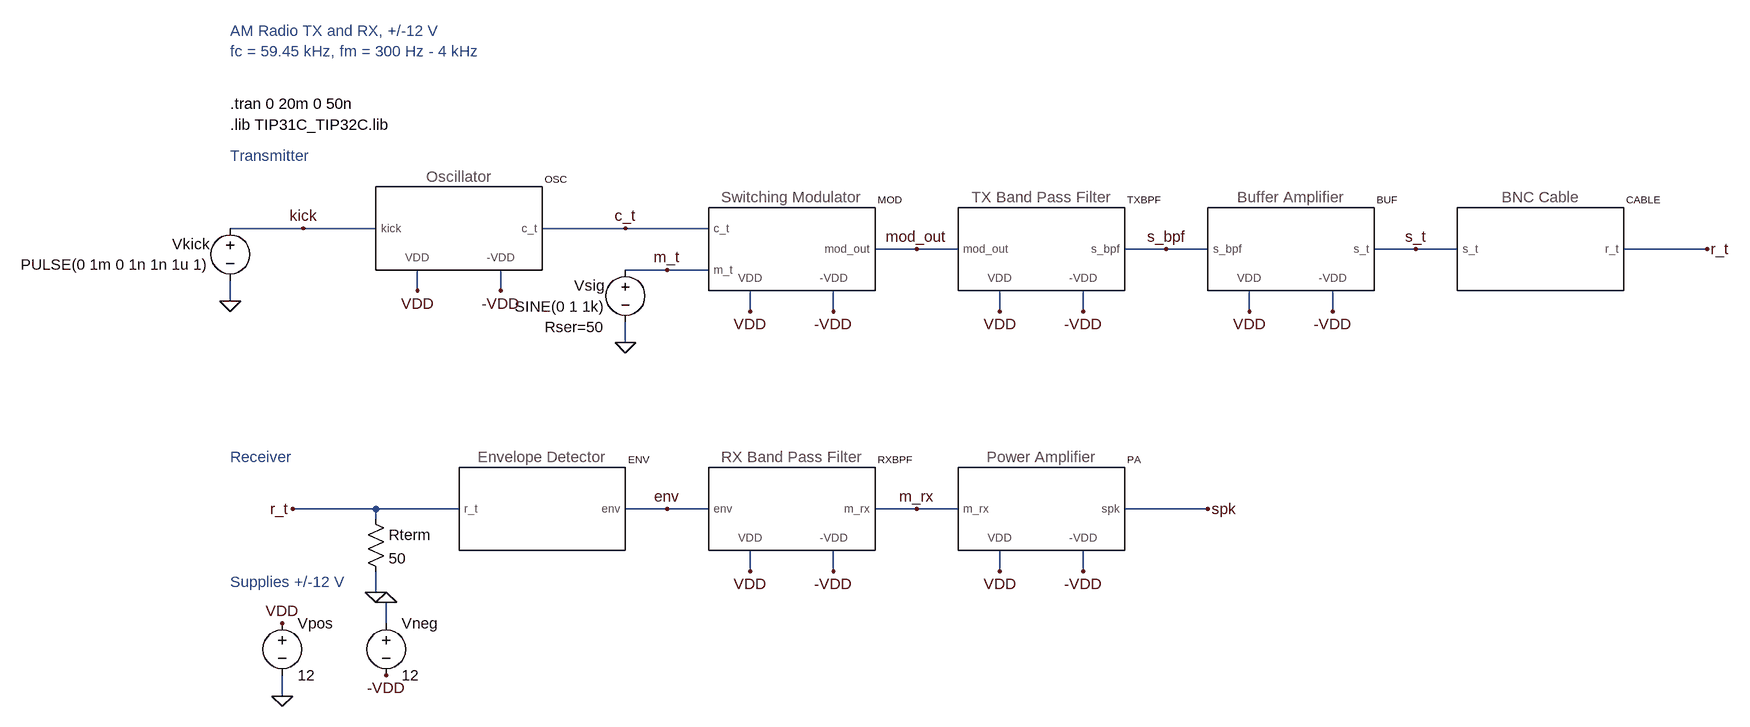
[diagram p0: schematic Top.asc]
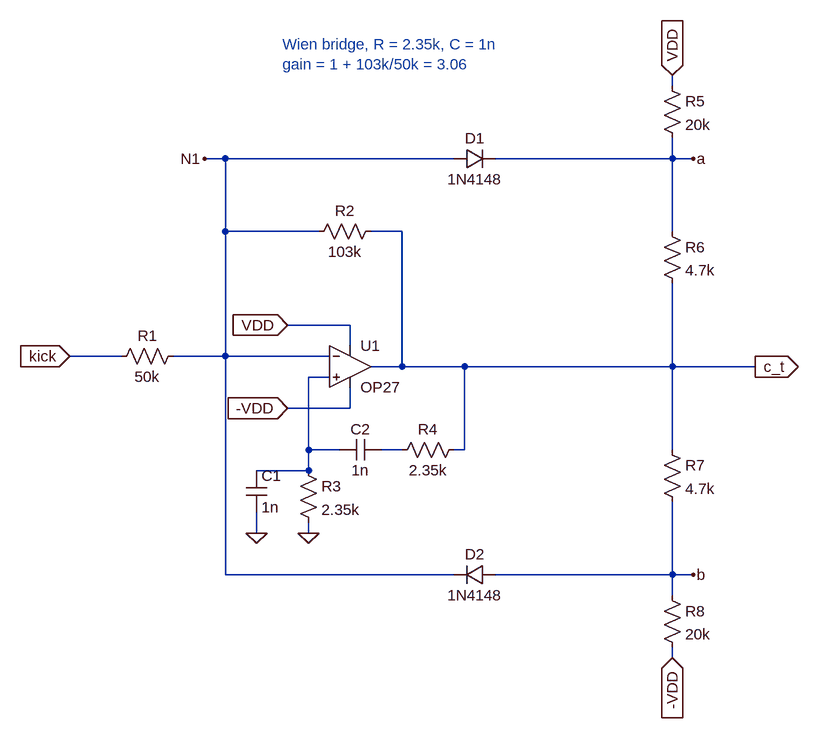
[diagram p1: sub-circuit oscillator.asc]
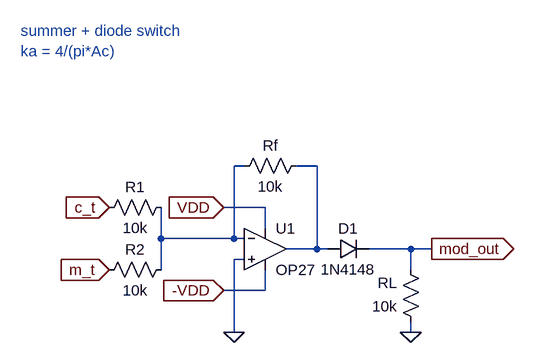
[diagram p2: sub-circuit switching_modulator.asc]
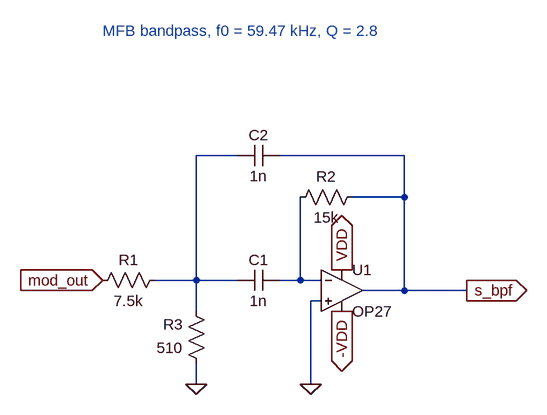
[diagram p3: sub-circuit band_pass_filter.asc]
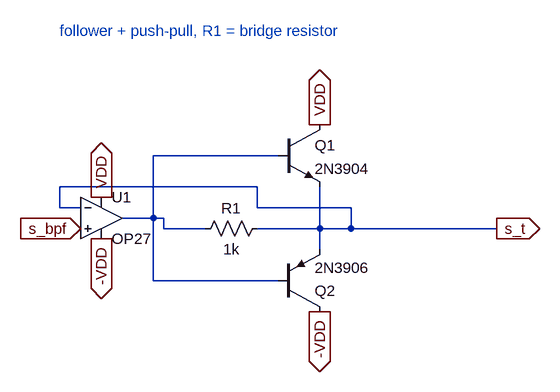
[diagram p4: sub-circuit buffer_amplifier.asc]
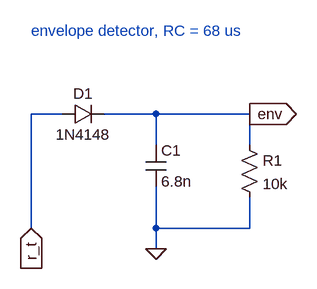
[diagram p5: sub-circuit envelope_detector.asc]
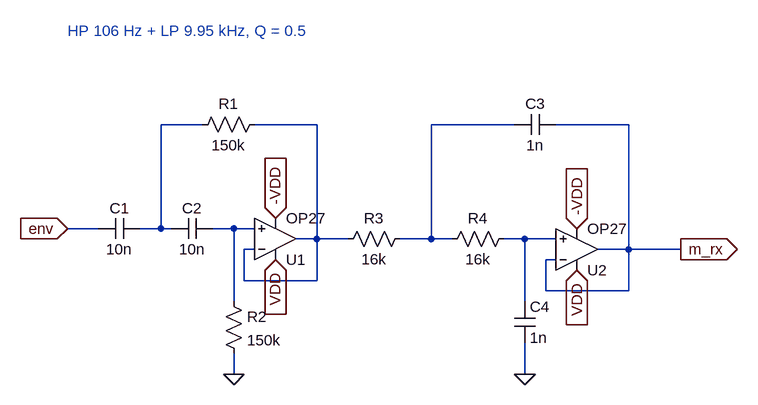
[diagram p6: sub-circuit band_pass_filter_rx.asc]
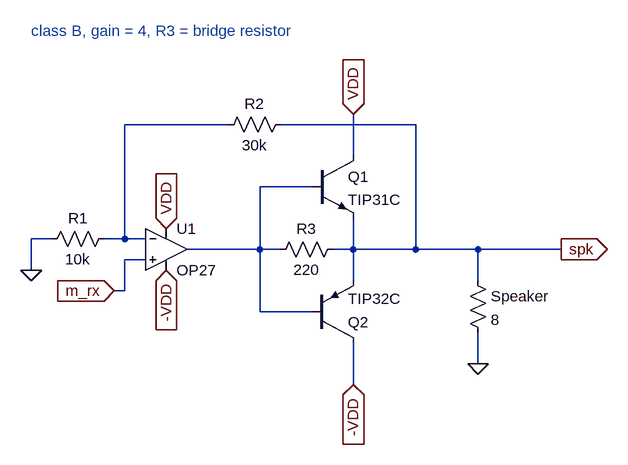
[diagram p7: sub-circuit power_amp_rx.asc]
Top.asc, the LTspice schematic file:
Version 4.1
SHEET 1 2000 1000
WIRE -480 -32 -256 -32
WIRE -480 48 -480 80
WIRE -192 32 -192 64
WIRE -64 32 -64 64
WIRE 0 -32 256 -32
WIRE 128 32 256 32
WIRE 128 112 128 144
WIRE 320 64 320 96
WIRE 448 64 448 96
WIRE 512 0 640 0
WIRE 704 64 704 96
WIRE 832 64 832 96
WIRE 896 0 1024 0
WIRE 1088 64 1088 96
WIRE 1216 64 1216 96
WIRE 128 400 256 400
WIRE 320 464 320 496
WIRE 448 464 448 496
WIRE 512 400 640 400
WIRE 704 464 704 496
WIRE 832 464 832 496
WIRE 896 400 1024 400
WIRE -400 656 -400 688
WIRE -240 576 -240 544
WIRE 1280 0 1408 0
WIRE 1664 0 1792 0
WIRE -384 400 -128 400
WIRE -256 416 -256 400
WIRE -256 528 -256 496
FLAG -368 -32 kick
FLAG -480 80 0
FLAG -192 64 VDD
FLAG -64 64 -VDD
FLAG 128 -32 c_t
FLAG 192 32 m_t
FLAG 128 144 0
FLAG 320 96 VDD
FLAG 448 96 -VDD
FLAG 576 0 mod_out
FLAG 704 96 VDD
FLAG 832 96 -VDD
FLAG 960 0 s_bpf
FLAG 1088 96 VDD
FLAG 1216 96 -VDD
FLAG 192 400 env
FLAG 320 496 VDD
FLAG 448 496 -VDD
FLAG 576 400 m_rx
FLAG 704 496 VDD
FLAG 832 496 -VDD
FLAG 1024 400 spk
FLAG -400 576 VDD
FLAG -400 688 0
FLAG -240 544 0
FLAG -240 656 -VDD
FLAG 1344 0 s_t
FLAG 1792 0 r_t
FLAG -384 400 r_t
FLAG -256 528 0
SYMBOL voltage -480 -48 R0
WINDOW 0 -32 40 Right 2
WINDOW 3 -32 72 Right 2
WINDOW 39 -32 104 Right 2
WINDOW 123 0 0 Left 0
SYMATTR InstName Vkick
SYMATTR Value PULSE(0 1m 0 1n 1n 1u 1)
SYMBOL Oscillator -128 -32 R0
SYMATTR InstName OSC
SYMBOL voltage 128 16 R0
WINDOW 0 -32 40 Right 2
WINDOW 3 -32 72 Right 2
WINDOW 39 -32 104 Right 2
WINDOW 123 0 0 Left 0
SYMATTR SpiceLine Rser=50
SYMATTR InstName Vsig
SYMATTR Value SINE(0 1 1k)
SYMBOL Switching_Modulator 384 0 R0
SYMATTR InstName MOD
SYMBOL Band_Pass_Filter 768 0 R0
SYMATTR InstName TXBPF
SYMBOL Buffer_Amplifier 1152 0 R0
SYMATTR InstName BUF
SYMBOL Envelope_Detector 0 400 R0
SYMATTR InstName ENV
SYMBOL Band_Pass_Filter_RX 384 400 R0
SYMATTR InstName RXBPF
SYMBOL Power_Amp_RX 768 400 R0
SYMATTR InstName PA
SYMBOL voltage -400 560 R0
WINDOW 123 0 0 Left 0
WINDOW 39 0 0 Left 0
SYMATTR InstName Vpos
SYMATTR Value 12
SYMBOL voltage -240 560 R0
WINDOW 123 0 0 Left 0
WINDOW 39 0 0 Left 0
SYMATTR InstName Vneg
SYMATTR Value 12
SYMBOL BNC_Cable 1536 0 R0
SYMATTR InstName CABLE
SYMBOL res -272 400 R0
SYMATTR InstName Rterm
SYMATTR Value 50
TEXT -480 -336 Left 2 ;AM Radio TX and RX, +/-12 V\nfc = 59.45 kHz, fm = 300 Hz - 4 kHz
TEXT -480 -224 Left 2 !.tran 0 20m 0 50n
TEXT -480 -192 Left 2 !.lib TIP31C_TIP32C.lib
TEXT -480 -144 Left 2 ;Transmitter
TEXT -480 320 Left 2 ;Receiver
TEXT -480 512 Left 2 ;Supplies +/-12 V

oscillator.asc, the sub-circuit schematic file:
Version 4.1
SHEET 1 1652 1700
WIRE -1840 560 -1840 544
WIRE -2528 672 -2560 672
WIRE -2176 672 -2528 672
WIRE -1840 672 -1840 640
WIRE -1840 672 -2112 672
WIRE -1808 672 -1840 672
WIRE -2528 784 -2528 672
WIRE -2384 784 -2528 784
WIRE -2256 784 -2304 784
WIRE -1840 784 -1840 672
WIRE -2336 928 -2432 928
WIRE -2336 960 -2336 928
WIRE -2688 976 -2768 976
WIRE -2528 976 -2528 784
WIRE -2528 976 -2608 976
WIRE -2368 976 -2528 976
WIRE -2256 992 -2256 784
WIRE -2256 992 -2304 992
WIRE -2160 992 -2256 992
WIRE -1840 992 -1840 864
WIRE -1840 992 -2160 992
WIRE -1712 992 -1840 992
WIRE -2368 1008 -2400 1008
WIRE -2336 1056 -2336 1024
WIRE -2336 1056 -2432 1056
WIRE -2400 1120 -2400 1008
WIRE -2352 1120 -2400 1120
WIRE -2256 1120 -2288 1120
WIRE -2160 1120 -2160 992
WIRE -2160 1120 -2176 1120
WIRE -1840 1120 -1840 992
WIRE -2400 1152 -2400 1120
WIRE -2400 1152 -2480 1152
WIRE -2480 1248 -2480 1216
WIRE -2400 1248 -2400 1232
WIRE -2528 1312 -2528 976
WIRE -2176 1312 -2528 1312
WIRE -1840 1312 -1840 1200
WIRE -1840 1312 -2112 1312
WIRE -1808 1312 -1840 1312
WIRE -1840 1344 -1840 1312
WIRE -1840 1440 -1840 1424
FLAG -1840 544 VDD
IOPIN -1840 544 In
FLAG -1840 1440 -VDD
IOPIN -1840 1440 In
FLAG -2432 928 VDD
IOPIN -2432 928 In
FLAG -2432 1056 -VDD
IOPIN -2432 1056 In
FLAG -2560 672 N1
FLAG -1808 672 a
FLAG -1808 1312 b
FLAG -1712 992 c_t
IOPIN -1712 992 Out
FLAG -2480 1248 0
FLAG -2400 1248 0
FLAG -2768 976 kick
IOPIN -2768 976 In
SYMBOL diode -2176 688 R270
WINDOW 0 32 32 VTop 2
WINDOW 3 0 32 VBottom 2
SYMATTR InstName D1
SYMATTR Value 1N4148
SYMBOL OpAmps\\OP27 -2336 928 R0
SYMATTR InstName U1
SYMBOL res -2288 768 R90
WINDOW 0 0 56 VBottom 2
WINDOW 3 32 56 VTop 2
SYMATTR InstName R2
SYMATTR Value 103k
SYMBOL res -2592 960 R90
WINDOW 0 0 56 VBottom 2
WINDOW 3 32 56 VTop 2
SYMATTR InstName R1
SYMATTR Value 50k
SYMBOL cap -2496 1152 R0
SYMATTR InstName C1
SYMATTR Value 1n
SYMBOL res -2416 1136 R0
SYMATTR InstName R3
SYMATTR Value 2.35k
SYMBOL cap -2288 1104 R90
WINDOW 0 0 32 VBottom 2
WINDOW 3 32 32 VTop 2
SYMATTR InstName C2
SYMATTR Value 1n
SYMBOL res -2160 1104 R90
WINDOW 0 0 56 VBottom 2
WINDOW 3 32 56 VTop 2
SYMATTR InstName R4
SYMATTR Value 2.35k
SYMBOL diode -2112 1296 R90
WINDOW 0 0 32 VBottom 2
WINDOW 3 32 32 VTop 2
SYMATTR InstName D2
SYMATTR Value 1N4148
SYMBOL res -1856 544 R0
SYMATTR InstName R5
SYMATTR Value 20k
SYMBOL res -1856 768 R0
SYMATTR InstName R6
SYMATTR Value 4.7k
SYMBOL res -1856 1104 R0
SYMATTR InstName R7
SYMATTR Value 4.7k
SYMBOL res -1856 1328 R0
SYMATTR InstName R8
SYMATTR Value 20k
TEXT -2440 496 Left 2 ;Wien bridge, R = 2.35k, C = 1n\ngain = 1 + 103k/50k = 3.06

switching_modulator.asc, the sub-circuit schematic file:
Version 4.1
SHEET 1 880 680
WIRE -80 -352 -96 -352
WIRE 32 -352 0 -352
WIRE -48 -288 -112 -288
WIRE -48 -256 -48 -288
WIRE -208 -240 -208 -288
WIRE -96 -240 -96 -352
WIRE -96 -240 -208 -240
WIRE -80 -240 -96 -240
WIRE 32 -224 32 -352
WIRE 32 -224 -16 -224
WIRE 48 -224 32 -224
WIRE 176 -224 112 -224
WIRE 208 -224 176 -224
WIRE -80 -208 -96 -208
WIRE -208 -192 -208 -240
WIRE 176 -192 176 -224
WIRE -48 -160 -48 -192
WIRE -48 -160 -112 -160
WIRE -96 -96 -96 -208
WIRE 176 -96 176 -112
FLAG -96 -96 0
FLAG 176 -96 0
FLAG -112 -288 VDD
IOPIN -112 -288 In
FLAG -112 -160 -VDD
IOPIN -112 -160 In
FLAG 208 -224 mod_out
IOPIN 208 -224 Out
FLAG -288 -288 c_t
IOPIN -288 -288 In
FLAG -288 -192 m_t
IOPIN -288 -192 In
SYMBOL OpAmps\\OP27 -48 -288 R0
SYMATTR InstName U1
SYMBOL res 16 -368 R90
WINDOW 0 0 56 VBottom 2
WINDOW 3 32 56 VTop 2
SYMATTR InstName Rf
SYMATTR Value 10k
SYMBOL res 192 -96 R180
WINDOW 0 36 76 Left 2
WINDOW 3 36 40 Left 2
SYMATTR InstName RL
SYMATTR Value 10k
SYMBOL res -304 -176 R270
WINDOW 0 32 56 VTop 2
WINDOW 3 0 56 VBottom 2
SYMATTR InstName R2
SYMATTR Value 10k
SYMBOL res -304 -272 R270
WINDOW 0 32 56 VTop 2
WINDOW 3 0 56 VBottom 2
SYMATTR InstName R1
SYMATTR Value 10k
SYMBOL diode 48 -208 R270
WINDOW 0 32 32 VTop 2
WINDOW 3 0 32 VBottom 2
SYMATTR InstName D1
SYMATTR Value 1N4148
TEXT -424 -560 Left 2 ;summer + diode switch\nka = 4/(pi*Ac)

band_pass_filter.asc, the sub-circuit schematic file:
Version 4.1
SHEET 1 2756 680
WIRE 48 -480 -16 -480
WIRE 304 -480 112 -480
WIRE 304 -416 304 -480
WIRE 304 -416 224 -416
WIRE -16 -288 -16 -480
WIRE -16 -288 -80 -288
WIRE 48 -288 -16 -288
WIRE 144 -288 144 -416
WIRE 144 -288 112 -288
WIRE 176 -288 144 -288
WIRE 304 -272 304 -416
WIRE 304 -272 240 -272
WIRE 400 -272 304 -272
WIRE 176 -256 160 -256
WIRE -16 -240 -16 -288
WIRE -16 -128 -16 -160
WIRE 160 -128 160 -256
FLAG -16 -128 0
FLAG 160 -128 0
FLAG 400 -272 s_bpf
IOPIN 400 -272 Out
FLAG 208 -304 VDD
IOPIN 208 -304 Out
FLAG 208 -240 -VDD
IOPIN 208 -240 Out
FLAG -160 -288 mod_out
IOPIN -160 -288 In
SYMBOL OpAmps\\OP27 208 -336 R0
SYMATTR InstName U1
SYMBOL cap 112 -304 R90
WINDOW 0 0 32 VBottom 2
WINDOW 3 32 32 VTop 2
SYMATTR InstName C1
SYMATTR Value 1n
SYMBOL cap 112 -496 R90
WINDOW 0 0 32 VBottom 2
WINDOW 3 32 32 VTop 2
SYMATTR InstName C2
SYMATTR Value 1n
SYMBOL res -64 -304 R90
WINDOW 0 0 56 VBottom 2
WINDOW 3 32 56 VTop 2
SYMATTR InstName R1
SYMATTR Value 7.5k
SYMBOL res 240 -432 R90
WINDOW 0 0 56 VBottom 2
WINDOW 3 32 56 VTop 2
SYMATTR InstName R2
SYMATTR Value 15k
SYMBOL res 0 -144 R180
WINDOW 0 36 76 Left 2
WINDOW 3 36 40 Left 2
SYMATTR InstName R3
SYMATTR Value 510
TEXT -160 -672 Left 2 ;MFB bandpass, f0 = 59.47 kHz, Q = 2.8

buffer_amplifier.asc, the sub-circuit schematic file:
Version 4.1
SHEET 1 892 680
WIRE -576 -576 -768 -576
WIRE -608 -528 -912 -528
WIRE -912 -496 -912 -528
WIRE -880 -496 -912 -496
WIRE -608 -496 -608 -528
WIRE -464 -496 -608 -496
WIRE -768 -480 -768 -576
WIRE -768 -480 -816 -480
WIRE -752 -480 -768 -480
WIRE -752 -464 -752 -480
WIRE -688 -464 -752 -464
WIRE -512 -464 -512 -528
WIRE -512 -464 -608 -464
WIRE -464 -464 -464 -496
WIRE -464 -464 -512 -464
WIRE -240 -464 -464 -464
WIRE -512 -432 -512 -464
WIRE -768 -384 -768 -480
WIRE -576 -384 -768 -384
FLAG -848 -512 VDD
IOPIN -848 -512 Out
FLAG -848 -448 -VDD
IOPIN -848 -448 Out
FLAG -512 -336 -VDD
IOPIN -512 -336 Out
FLAG -512 -624 VDD
IOPIN -512 -624 Out
FLAG -880 -464 s_bpf
IOPIN -880 -464 In
FLAG -240 -464 s_t
IOPIN -240 -464 Out
SYMBOL npn -576 -624 R0
SYMATTR InstName Q1
SYMATTR Value 2N3904
SYMBOL pnp -576 -336 M180
SYMATTR InstName Q2
SYMATTR Value 2N3906
SYMBOL OpAmps\\OP27 -848 -544 R0
SYMATTR InstName U1
SYMBOL res -592 -480 R90
WINDOW 0 0 56 VBottom 2
WINDOW 3 32 56 VTop 2
SYMATTR InstName R1
SYMATTR Value 1k
TEXT -912 -768 Left 2 ;follower + push-pull, R1 = bridge resistor

envelope_detector.asc, the sub-circuit schematic file:
Version 4.1
SHEET 1 880 680
WIRE 112 32 64 32
WIRE 256 32 176 32
WIRE 400 32 256 32
WIRE 256 80 256 32
WIRE 400 80 400 32
WIRE 64 208 64 32
WIRE 256 208 256 144
WIRE 400 208 400 160
WIRE 400 208 256 208
WIRE 256 240 256 208
FLAG 400 32 env
IOPIN 400 32 Out
FLAG 64 208 r_t
IOPIN 64 208 In
FLAG 256 240 0
SYMBOL diode 112 48 R270
WINDOW 0 32 32 VTop 2
WINDOW 3 0 32 VBottom 2
SYMATTR InstName D1
SYMATTR Value 1N4148
SYMBOL cap 240 80 R0
SYMATTR InstName C1
SYMATTR Value 6.8n
SYMBOL res 384 64 R0
SYMATTR InstName R1
SYMATTR Value 10k
TEXT 64 -96 Left 2 ;envelope detector, RC = 68 us

band_pass_filter_rx.asc, the sub-circuit schematic file:
Version 4.1
SHEET 1 1048 680
WIRE 112 -48 48 -48
WIRE 288 -48 192 -48
WIRE 592 -48 464 -48
WIRE 768 -48 656 -48
WIRE -48 112 -96 112
WIRE 48 112 48 -48
WIRE 48 112 16 112
WIRE 64 112 48 112
WIRE 160 112 128 112
WIRE 192 112 160 112
WIRE 288 128 288 -48
WIRE 288 128 256 128
WIRE 336 128 288 128
WIRE 464 128 464 -48
WIRE 464 128 416 128
WIRE 496 128 464 128
WIRE 608 128 576 128
WIRE 656 128 608 128
WIRE 192 144 176 144
WIRE 768 144 768 -48
WIRE 768 144 720 144
WIRE 848 144 768 144
WIRE 656 160 640 160
WIRE 176 192 176 144
WIRE 288 192 288 128
WIRE 288 192 176 192
WIRE 640 208 640 160
WIRE 768 208 768 144
WIRE 768 208 640 208
WIRE 160 224 160 112
WIRE 608 224 608 128
WIRE 160 336 160 304
WIRE 608 336 608 288
FLAG 608 336 0
FLAG 160 336 0
FLAG 224 160 VDD
IOPIN 224 160 In
FLAG 688 112 -VDD
IOPIN 688 112 In
FLAG 224 96 -VDD
IOPIN 224 96 In
FLAG 688 176 VDD
IOPIN 688 176 In
FLAG 848 144 m_rx
IOPIN 848 144 Out
FLAG -96 112 env
IOPIN -96 112 In
SYMBOL OpAmps\\OP27 224 192 M180
SYMATTR InstName U1
SYMBOL OpAmps\\OP27 688 208 M180
SYMATTR InstName U2
SYMBOL cap 16 96 R90
WINDOW 0 0 32 VBottom 2
WINDOW 3 32 32 VTop 2
SYMATTR InstName C1
SYMATTR Value 10n
SYMBOL cap 128 96 R90
WINDOW 0 0 32 VBottom 2
WINDOW 3 32 32 VTop 2
SYMATTR InstName C2
SYMATTR Value 10n
SYMBOL res 208 -64 R90
WINDOW 0 0 56 VBottom 2
WINDOW 3 32 56 VTop 2
SYMATTR InstName R1
SYMATTR Value 150k
SYMBOL res 144 208 R0
SYMATTR InstName R2
SYMATTR Value 150k
SYMBOL res 432 112 R90
WINDOW 0 0 56 VBottom 2
WINDOW 3 32 56 VTop 2
SYMATTR InstName R3
SYMATTR Value 16k
SYMBOL res 592 112 R90
WINDOW 0 0 56 VBottom 2
WINDOW 3 32 56 VTop 2
SYMATTR InstName R4
SYMATTR Value 16k
SYMBOL cap 656 -64 R90
WINDOW 0 0 32 VBottom 2
WINDOW 3 32 32 VTop 2
SYMATTR InstName C3
SYMATTR Value 1n
SYMBOL cap 592 224 R0
SYMATTR InstName C4
SYMATTR Value 1n
TEXT -96 -192 Left 2 ;HP 106 Hz + LP 9.95 kHz, Q = 0.5

power_amp_rx.asc, the sub-circuit schematic file:
Version 4.1
SHEET 1 880 680
WIRE 144 -48 -16 -48
WIRE 432 -48 224 -48
WIRE 336 0 336 -64
WIRE 272 48 192 48
WIRE -128 128 -160 128
WIRE -16 128 -16 -48
WIRE -16 128 -48 128
WIRE 16 128 -16 128
WIRE 192 144 192 48
WIRE 192 144 80 144
WIRE 224 144 192 144
WIRE 336 144 336 96
WIRE 336 144 304 144
WIRE 432 144 432 -48
WIRE 432 144 336 144
WIRE 528 144 432 144
WIRE 656 144 528 144
WIRE 16 160 -16 160
WIRE -160 176 -160 128
WIRE 336 192 336 144
WIRE 528 192 528 144
WIRE -16 208 -16 160
WIRE -16 208 -32 208
WIRE 192 240 192 144
WIRE 272 240 192 240
WIRE 528 320 528 272
WIRE 336 352 336 288
FLAG 528 320 0
FLAG -160 176 0
FLAG -32 208 m_rx
IOPIN -32 208 In
FLAG 48 112 VDD
IOPIN 48 112 In
FLAG 48 176 -VDD
IOPIN 48 176 In
FLAG 336 -64 VDD
IOPIN 336 -64 In
FLAG 336 352 -VDD
IOPIN 336 352 In
FLAG 656 144 spk
IOPIN 656 144 Out
SYMBOL OpAmps\\OP27 48 80 R0
SYMATTR InstName U1
SYMBOL npn 272 0 R0
SYMATTR InstName Q1
SYMATTR Value TIP31C
SYMBOL pnp 272 288 M180
SYMATTR InstName Q2
SYMATTR Value TIP32C
SYMBOL res -32 112 R90
WINDOW 0 0 56 VBottom 2
WINDOW 3 32 56 VTop 2
SYMATTR InstName R1
SYMATTR Value 10k
SYMBOL res 240 -64 R90
WINDOW 0 0 56 VBottom 2
WINDOW 3 32 56 VTop 2
SYMATTR InstName R2
SYMATTR Value 30k
SYMBOL res 512 176 R0
SYMATTR InstName Speaker
SYMATTR Value 8
SYMBOL res 320 128 R90
WINDOW 0 0 56 VBottom 2
WINDOW 3 32 56 VTop 2
SYMATTR InstName R3
SYMATTR Value 220
TEXT -160 -192 Left 2 ;class B, gain = 4, R3 = bridge resistor

bnc_cable.asc, the sub-circuit schematic file:
Version 4.1
SHEET 1 880 680
WIRE -64 0 -96 0
WIRE 160 0 16 0
WIRE 64 96 64 64
FLAG -96 0 s_t
IOPIN -96 0 In
FLAG 160 0 r_t
IOPIN 160 0 Out
FLAG 64 96 0
SYMBOL ind 32 -16 R90
WINDOW 0 5 56 VBottom 2
WINDOW 3 32 56 VTop 2
SYMATTR InstName L1
SYMATTR Value 152n
SYMBOL cap 48 0 R0
SYMATTR InstName C1
SYMATTR Value 61p
TEXT -96 -128 Left 2 ;2 ft BNC cable

The netlist it stands for:
* Top.asc
Vkick kick 0 PULSE(0 1m 0 1n 1n 1u 1)
X§OSC kick c_t VDD -VDD oscillator
Vsig m_t 0 SINE(0 1 1k) Rser=50
X§MOD c_t m_t mod_out VDD -VDD switching_modulator
X§TXBPF mod_out s_bpf VDD -VDD band_pass_filter
X§BUF s_bpf s_t VDD -VDD buffer_amplifier
X§ENV r_t env envelope_detector
X§RXBPF env m_rx VDD -VDD band_pass_filter_rx
X§PA m_rx spk VDD -VDD power_amp_rx
Vpos VDD 0 12
Vneg 0 -VDD 12
X§CABLE s_t r_t bnc_cable
Rterm r_t 0 50

* block symbol definitions
.subckt oscillator kick c_t VDD -VDD
D1 N1 a 1N4148
X§U1 N001 N1 VDD -VDD c_t OP27  ; pins In+ In- V+ V- OUT
R2 c_t N1 103k
R1 N1 kick 50k
C1 N001 0 1n
R3 N001 0 2.35k
C2 N002 N001 1n
R4 c_t N002 2.35k
D2 b N1 1N4148
R5 VDD a 20k
R6 a c_t 4.7k
R7 c_t b 4.7k
R8 b -VDD 20k
* Wien bridge, R = 2.35k, C = 1n
* gain = 1 + 103k/50k = 3.06
.ends oscillator

.subckt switching_modulator c_t m_t mod_out VDD -VDD
X§U1 0 N001 VDD -VDD N002 OP27  ; pins In+ In- V+ V- OUT
Rf N002 N001 10k
RL 0 mod_out 10k
R2 m_t N001 10k
R1 c_t N001 10k
D1 N002 mod_out 1N4148
* summer + diode switch
* ka = 4/(pi*Ac)
.ends switching_modulator

.subckt band_pass_filter mod_out s_bpf VDD -VDD
X§U1 0 N002 VDD -VDD s_bpf OP27  ; pins In+ In- V+ V- OUT
C1 N002 N001 1n
C2 s_bpf N001 1n
R1 N001 mod_out 7.5k
R2 s_bpf N002 15k
R3 0 N001 510
* MFB bandpass, f0 = 59.47 kHz, Q = 2.8
.ends band_pass_filter

.subckt buffer_amplifier s_bpf s_t VDD -VDD
Q1 VDD N001 s_t 0 2N3904
Q2 -VDD N001 s_t 0 2N3906
X§U1 s_bpf s_t VDD -VDD N001 OP27  ; pins In+ In- V+ V- OUT
R1 s_t N001 1k
* follower + push-pull, R1 = bridge resistor
.ends buffer_amplifier

.subckt envelope_detector r_t env
D1 r_t env 1N4148
C1 env 0 6.8n
R1 env 0 10k
* envelope detector, RC = 68 us
.ends envelope_detector

.subckt band_pass_filter_rx env m_rx VDD -VDD
X§U1 N004 N002 VDD -VDD N002 OP27  ; pins In+ In- V+ V- OUT
X§U2 N005 m_rx VDD -VDD m_rx OP27  ; pins In+ In- V+ V- OUT
C1 N001 env 10n
C2 N004 N001 10n
R1 N002 N001 150k
R2 N004 0 150k
R3 N003 N002 16k
R4 N005 N003 16k
C3 m_rx N003 1n
C4 N005 0 1n
* HP 106 Hz + LP 9.95 kHz, Q = 0.5
.ends band_pass_filter_rx

.subckt power_amp_rx m_rx spk VDD -VDD
X§U1 m_rx N001 VDD -VDD N002 OP27  ; pins In+ In- V+ V- OUT
Q1 VDD N002 spk 0 TIP31C
Q2 -VDD N002 spk 0 TIP32C
R1 N001 0 10k
R2 spk N001 30k
R§Speaker spk 0 8
R3 spk N002 220
* class B, gain = 4, R3 = bridge resistor
.ends power_amp_rx

.subckt bnc_cable s_t r_t
L1 r_t s_t 152n
C1 r_t 0 61p
* 2 ft BNC cable
.ends bnc_cable

.model D D
.lib standard.dio
.model NPN NPN
.model PNP PNP
.lib standard.bjt
* AM Radio TX and RX, +/-12 V
* fc = 59.45 kHz, fm = 300 Hz - 4 kHz
.tran 0 20m 0 50n
.lib TIP31C_TIP32C.lib
* Transmitter
* Receiver
* Supplies +/-12 V
.lib ADI.lib
.backanno
.end